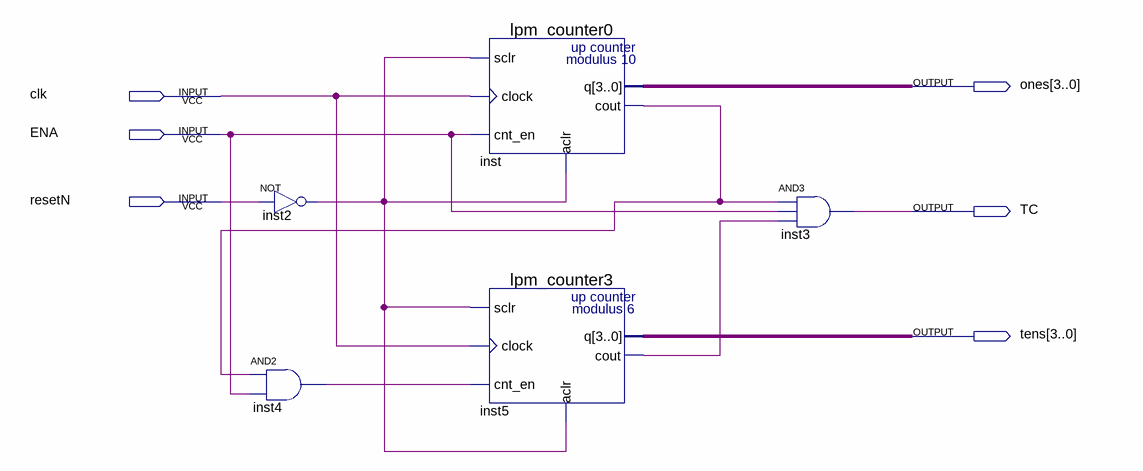
[diagram p0: schematic sheet]
// Quartus schematic modulo60-counter.bdf as structural Verilog: 5 symbols, 6 pins
module \modulo60-counter  (
  input  clk,
  input  ENA,
  input  resetN,
  output [3:0] ones,
  output TC,
  output [3:0] tens
);

  wire inst2_out, inst4_out, inst5_cout, inst_cout;

  not inst2 (inst2_out, resetN);
  and inst4 (inst4_out, inst_cout, ENA);
  lpm_counter0 inst (.sclr(inst2_out), .clock(clk), .cnt_en(ENA), .aclr(inst2_out), .q(ones), .cout(inst_cout));
  lpm_counter3 inst5 (.sclr(inst2_out), .clock(clk), .cnt_en(inst4_out), .aclr(inst2_out), .q(tens), .cout(inst5_cout));
  and inst3 (TC, inst_cout, ENA, inst5_cout);
endmodule
